# Altium project ODOS_PDB_prop.PrjPcb
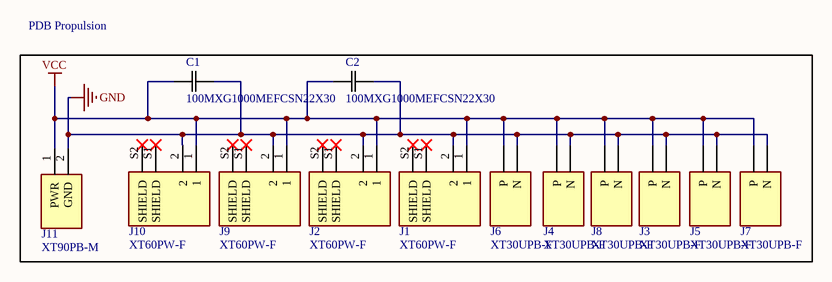
[diagram p0: ODOS_PDB_prop_schem.SchDoc]
1 sheet, 13 parts. Net scope: global (net labels, ports and power ports of the same name join across sheets).
Board file: ODOS_PDB_prop_pcb.PcbDoc

## Sheet ODOS_PDB_prop_schem.SchDoc
size A4; SheetNumber: 1; SheetTotal: 1

### Parts
C1  100MXG1000MEFCSN22X30  [CAP_MXC_22x30_RUB]
C2  100MXG1000MEFCSN22X30  [CAP_MXC_22x30_RUB]
J1  XT60PW-F  [AMASS_XT60PW-F]
J2  XT60PW-F  [AMASS_XT60PW-F]
J3  XT30UPB-F  [XT30UPBF]
J4  XT30UPB-F  [XT30UPBF]
J5  XT30UPB-F  [XT30UPBF]
J6  XT30UPB-F  [XT30UPBF]
J7  XT30UPB-F  [XT30UPBF]
J8  XT30UPB-F  [XT30UPBF]
J9  XT60PW-F  [AMASS_XT60PW-F]
J10  XT60PW-F  [AMASS_XT60PW-F]
J11  XT90PB-M  [XT90PB-M]

### Nets
GND: C1.2(GND) C2.2(GND) J1.2 J2.2 J3.2(N) J4.2(N) J5.2(N) J6.2(N) J7.2(N) J8.2(N) J9.2 J10.2 J11.2(GND)
VCC: C1.1(PWR) C2.1(PWR) J1.1 J2.1 J3.1(P) J4.1(P) J5.1(P) J6.1(P) J7.1(P) J8.1(P) J9.1 J10.1 J11.1(PWR)

Not connected (* = marked no-connect by the designer): J1 S1(SHIELD)* S2(SHIELD)*; J2 S1(SHIELD)* S2(SHIELD)*; J9 S1(SHIELD)* S2(SHIELD)*; J10 S1(SHIELD)* S2(SHIELD)*

### Notes on the sheet
- PDB Propulsion

### Library data of the parts
C1 C2 = 100MXG1000MEFCSN22X30: No Description Available; Manufacturer_Name: Rubycon; Copyright: Copyright (C) 2026 Ultra Librarian. All rights reserved.; Manufacturer_Part_Number: 100MXG1000MEFCSN22X30
J1 J2 J9 J10 = XT60PW-F: Socket DC Supply Connector Female; MF: AMASS; SnapEDA_Link: https://www.snapeda.com/parts/XT60PW-F/AMASS/view-part/?ref=snap; Package: Package; Availability: Not in stock; Price: None; Check_prices: https://www.snapeda.com/parts/XT60PW-F/AMASS/view-part/?ref=eda; MP: XT60PW-F; Value: *
J3-J8 = XT30UPB-F: Connector; Manufacturer_Name: Amass; Datasheet Link: https://www.tme.eu/Document/81f11ca924696756331f21b972812074/XT30PB-F.pdf; Height: 9.4mm; Manufacturer_Part_Number: XT30UPB-F
J11 = XT90PB-M: Connector: DC supply; socket; XT90; male; PIN: 2; on PCBs; THT; Manufacturer_Name: Amass; Geometry.Height: 19.7mm; Manufacturer_Part_Number: XT90PB-M; Mouser Part Number: *; Mouser Price/Stock: *; Arrow Part Number: *; Arrow Price/Stock: *; Datasheet Link: https://www.china-amass.com/biao/439.html; ComponentLink1Description: Supplier link; ComponentLink1URL: https://www.tme.eu/en/details/xt90pb-m/dc-power-connectors/amass/